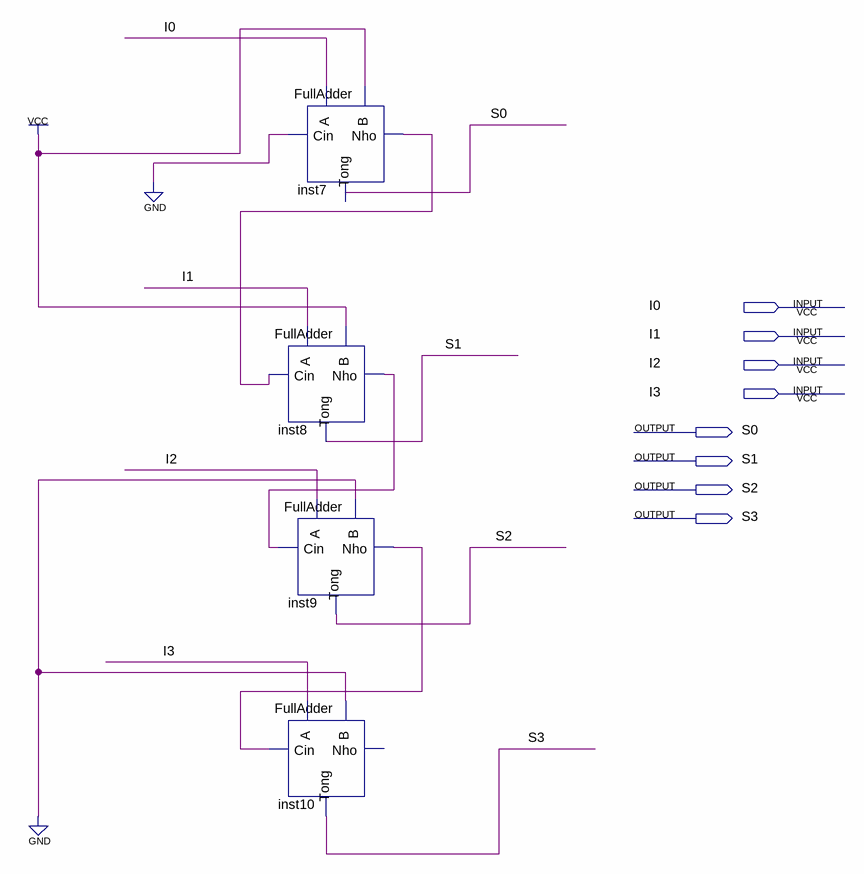
[diagram p0: schematic sheet]
// Quartus schematic ADD3.bdf as structural Verilog: 4 symbols, 8 pins
module ADD3 (
  input  I0,
  input  I1,
  input  I2,
  input  I3,
  output S0,
  output S1,
  output S2,
  output S3
);

  wire inst7_nho, inst8_nho, inst9_nho;

  FullAdder inst7 (.Cin(1'b0), .A(I0), .B(1'b1), .Tong(S0), .Nho(inst7_nho));
  FullAdder inst8 (.Cin(inst7_nho), .A(I1), .B(1'b1), .Tong(S1), .Nho(inst8_nho));
  FullAdder inst9 (.Cin(inst8_nho), .A(I2), .B(1'b0), .Tong(S2), .Nho(inst9_nho));
  FullAdder inst10 (.Cin(inst9_nho), .A(I3), .B(1'b0), .Tong(S3));  // open: Nho
endmodule
